# EasyEDA Pro project trumpx-ipadrescreen-ipad34-c6ab9950.epro, schematic SCH_A

## Sheets
1 main: Board Name: IPAD3_4_MB_HDMI_EDP; Create Date: 2025-06-30; Page Name: main; Project Name: IPADRESCREEN_IPAD3/4便携屏改造计划; Schematic Name: SCH_A; Update Date: 2025-07-09; Company: BSUIC; Page Size: A4; Version: V2.1
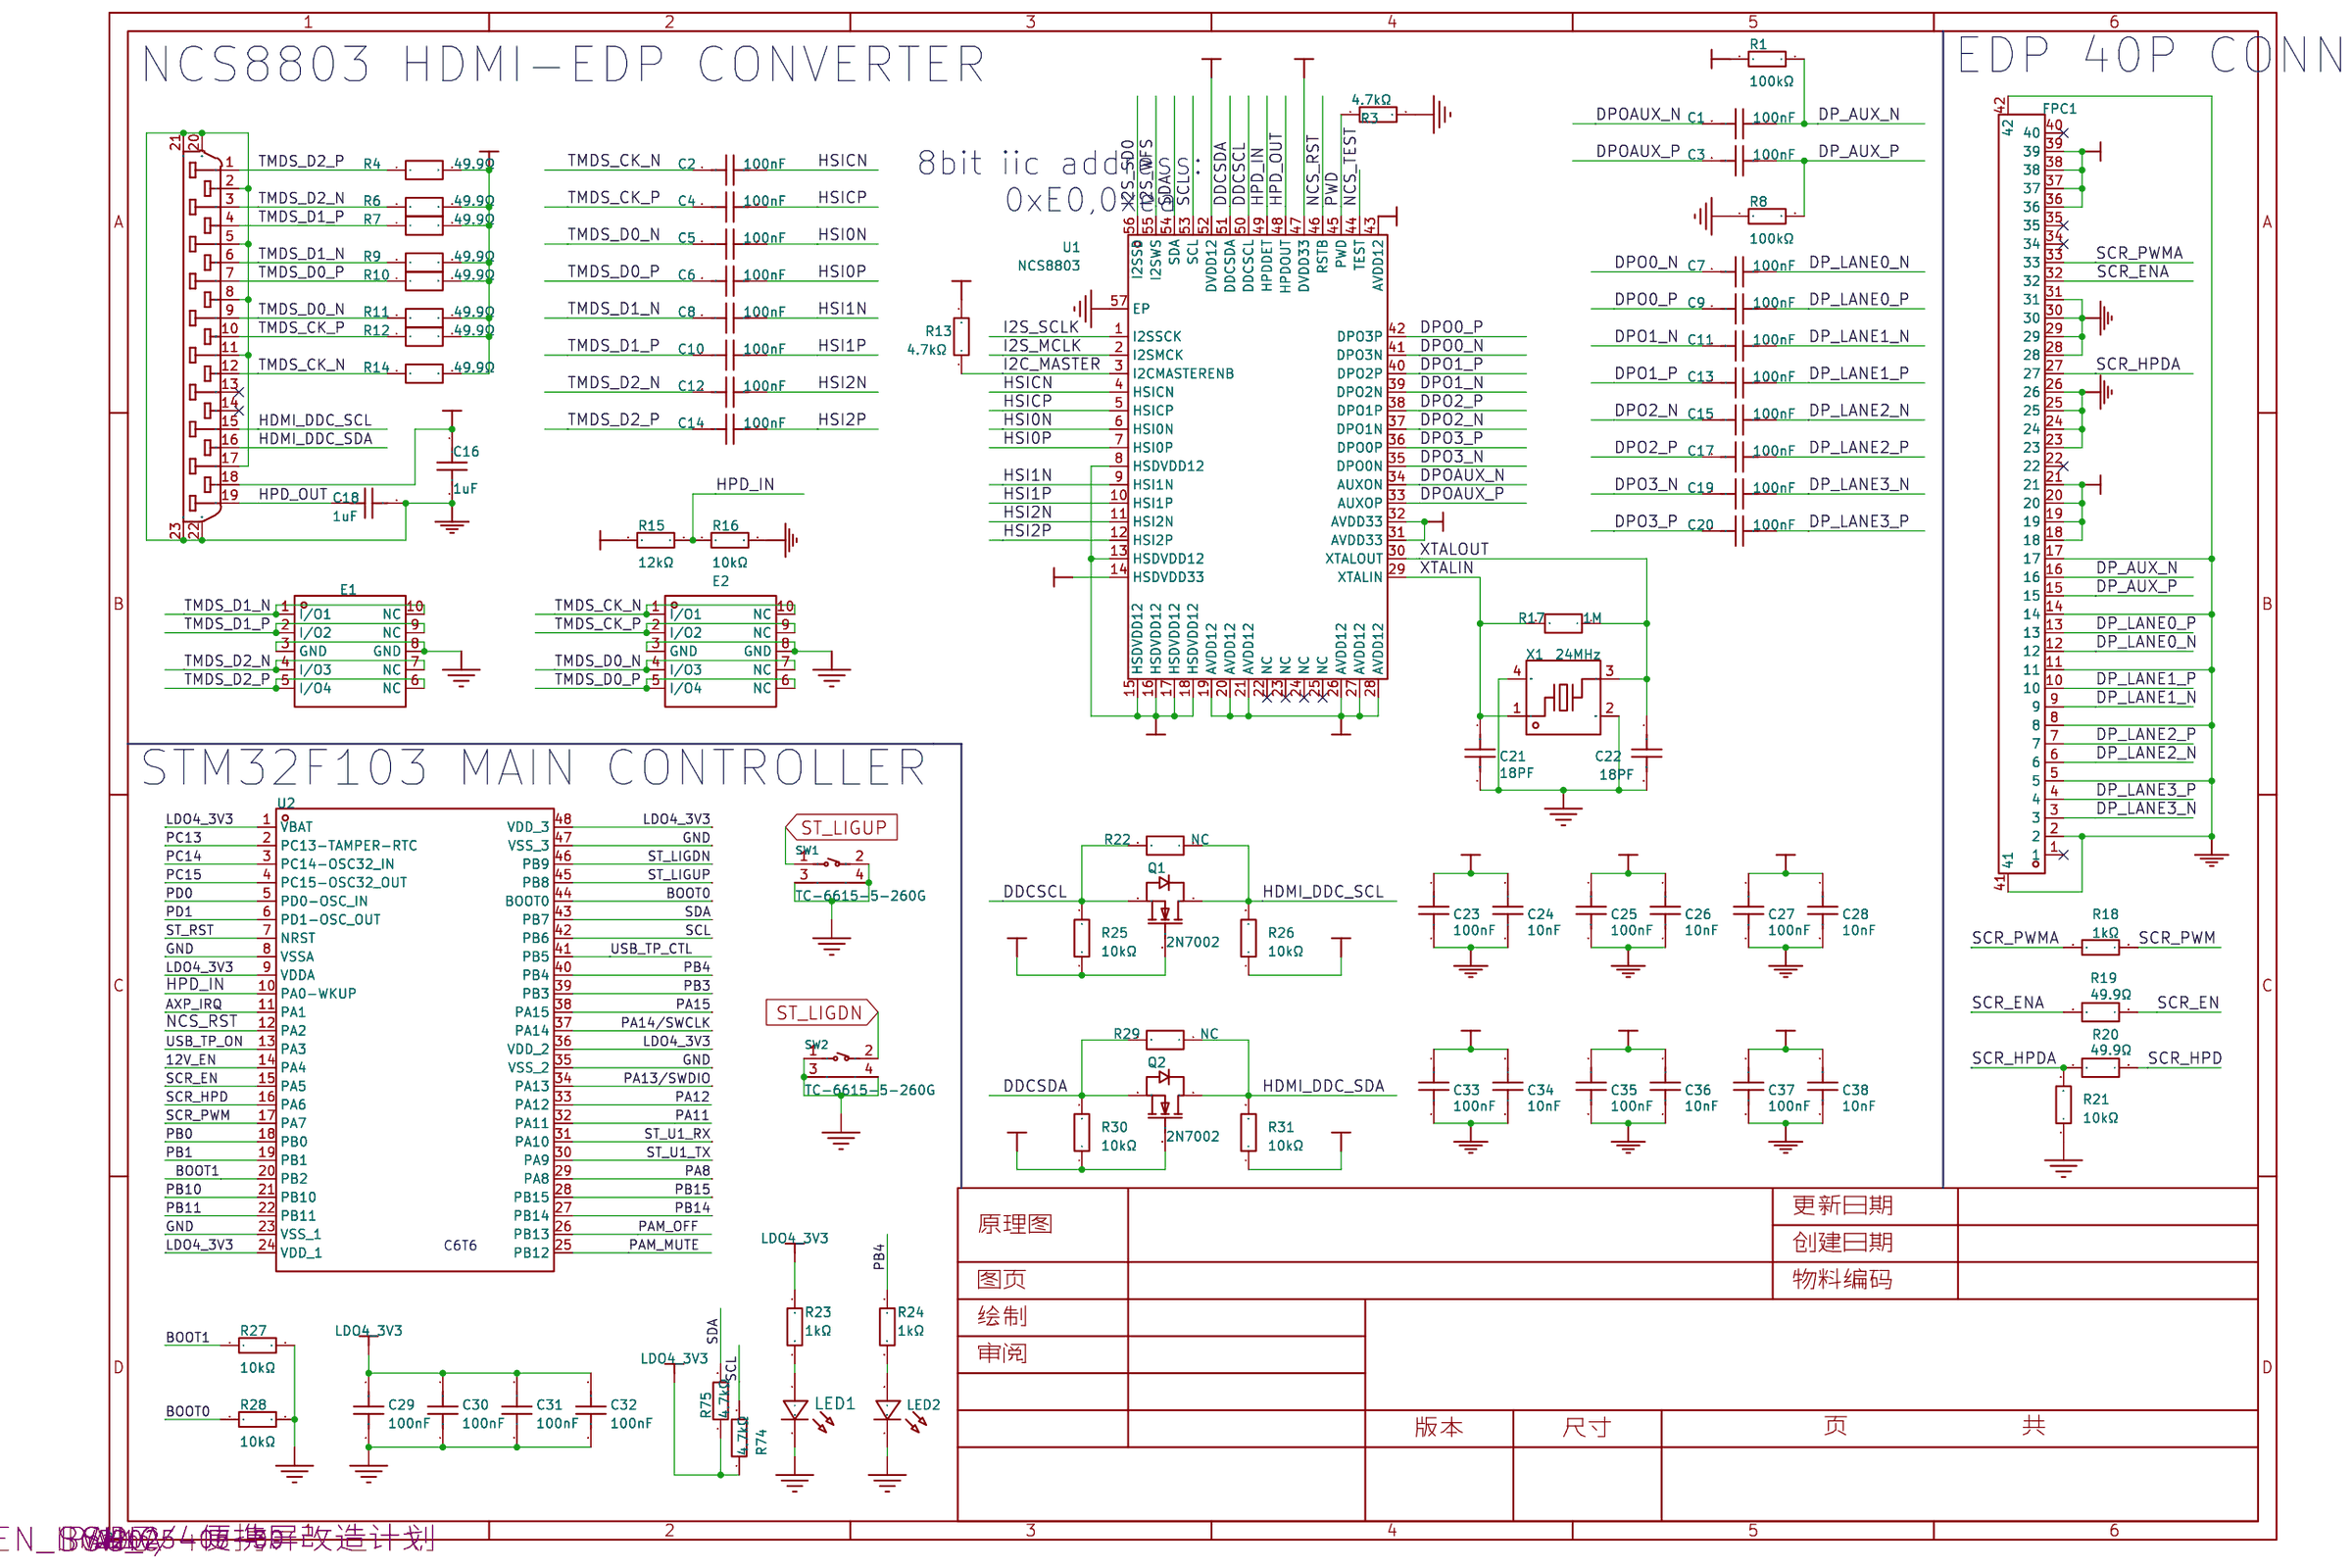
[diagram p0: main]
2 power: Page Name: power; Update Date: 2025-06-30; Company: 嘉立创EDA
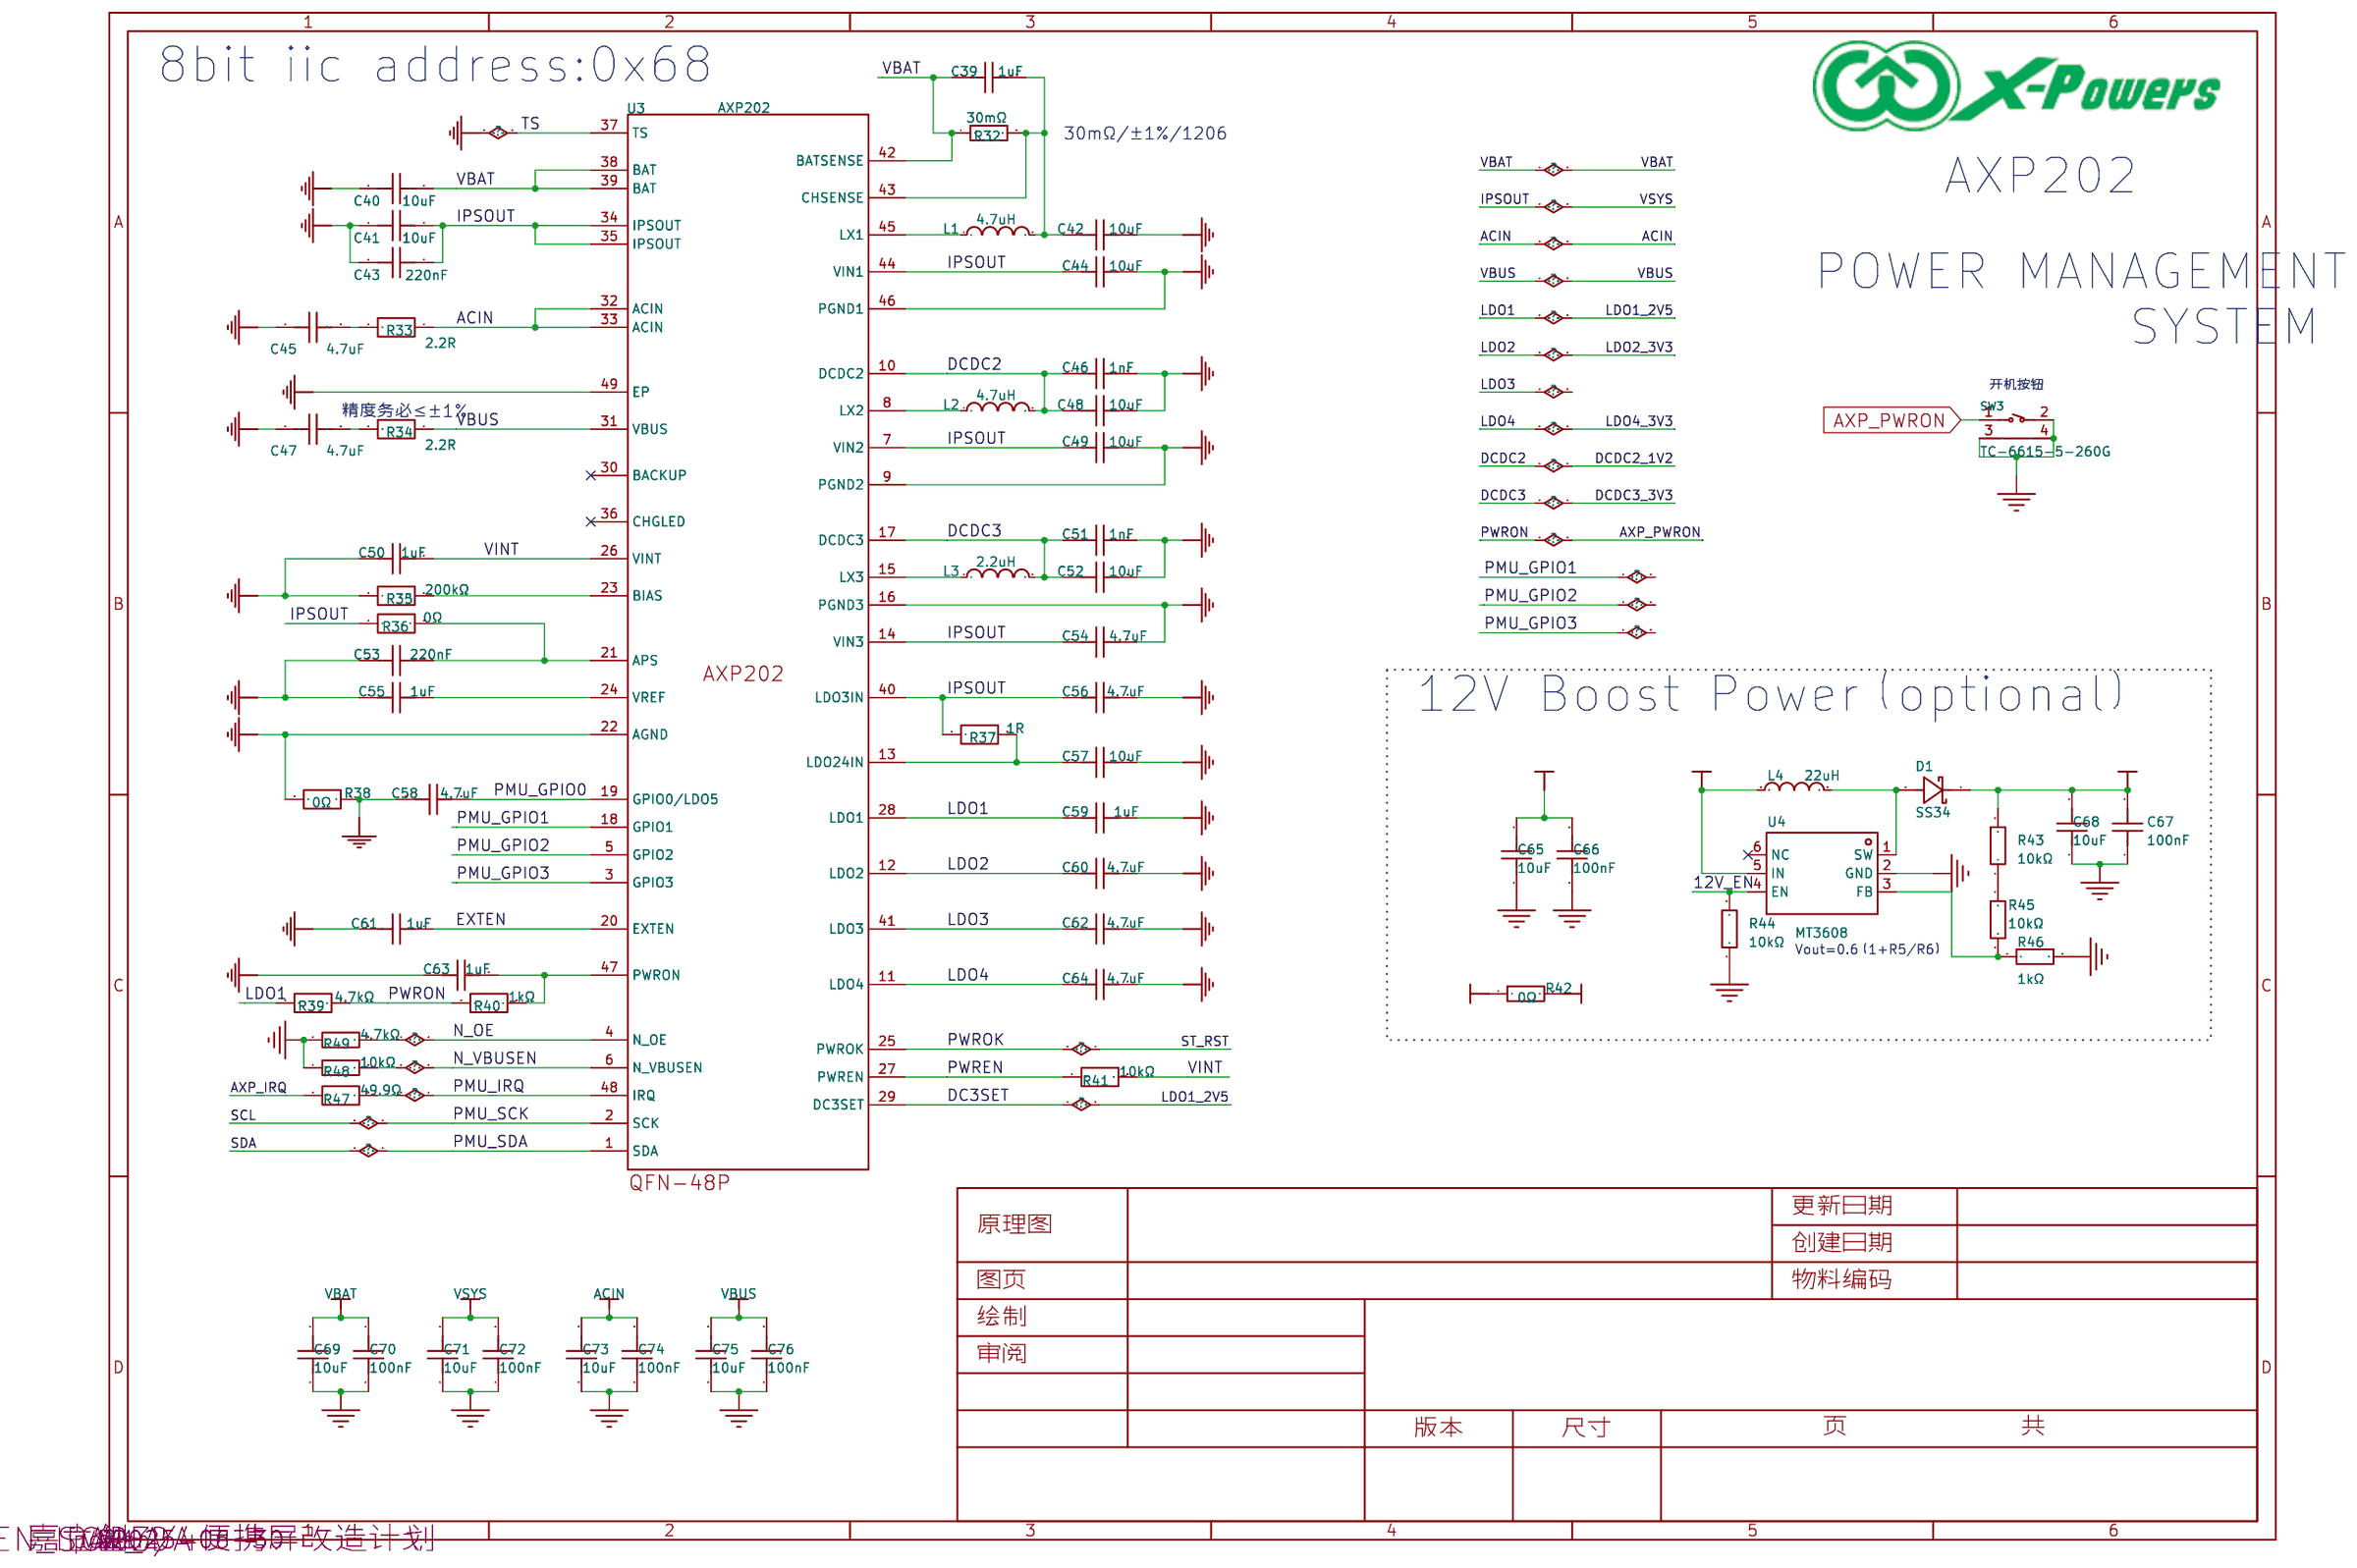
[diagram p1: power]
3 audio: Board Name: IPAD_RE_SCREEN_MB_V2.1; Page Name: audio; Project Name: IPADreSCREEN_IPAD3/4便携屏; Update Date: 2025-06-30
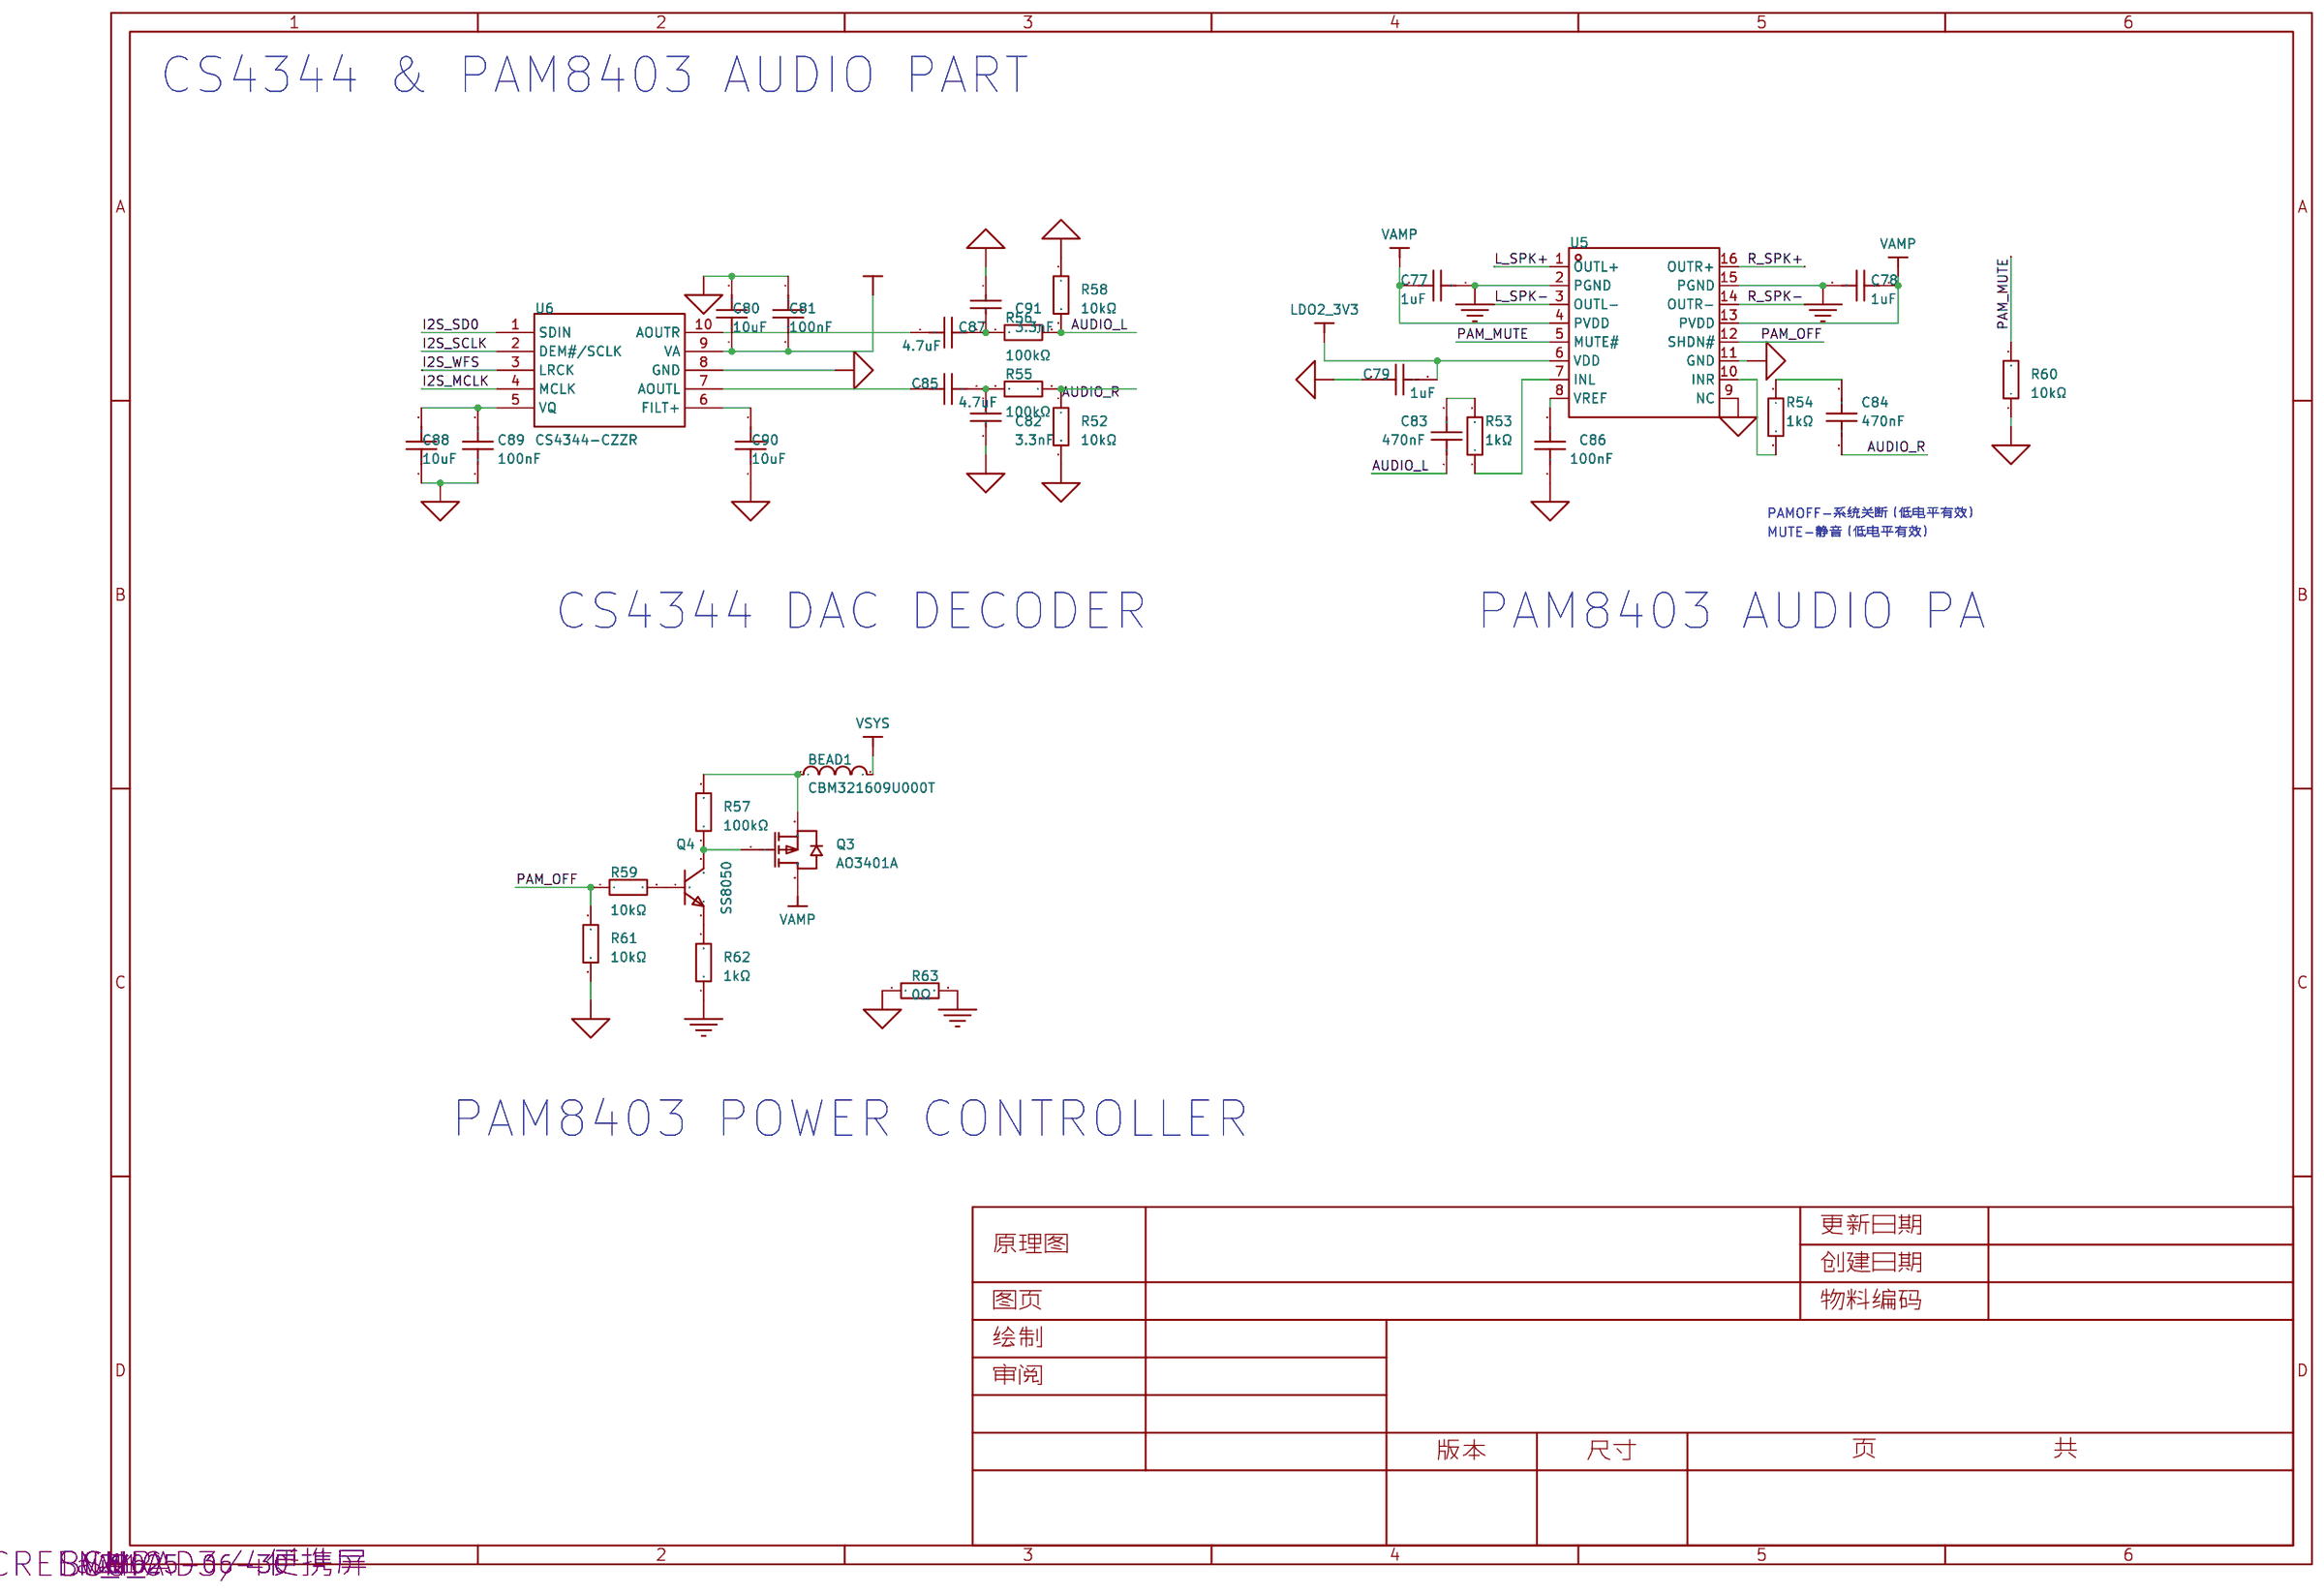
[diagram p2: audio]
4 connector: Page Name: connector; Update Date: 2025-06-30
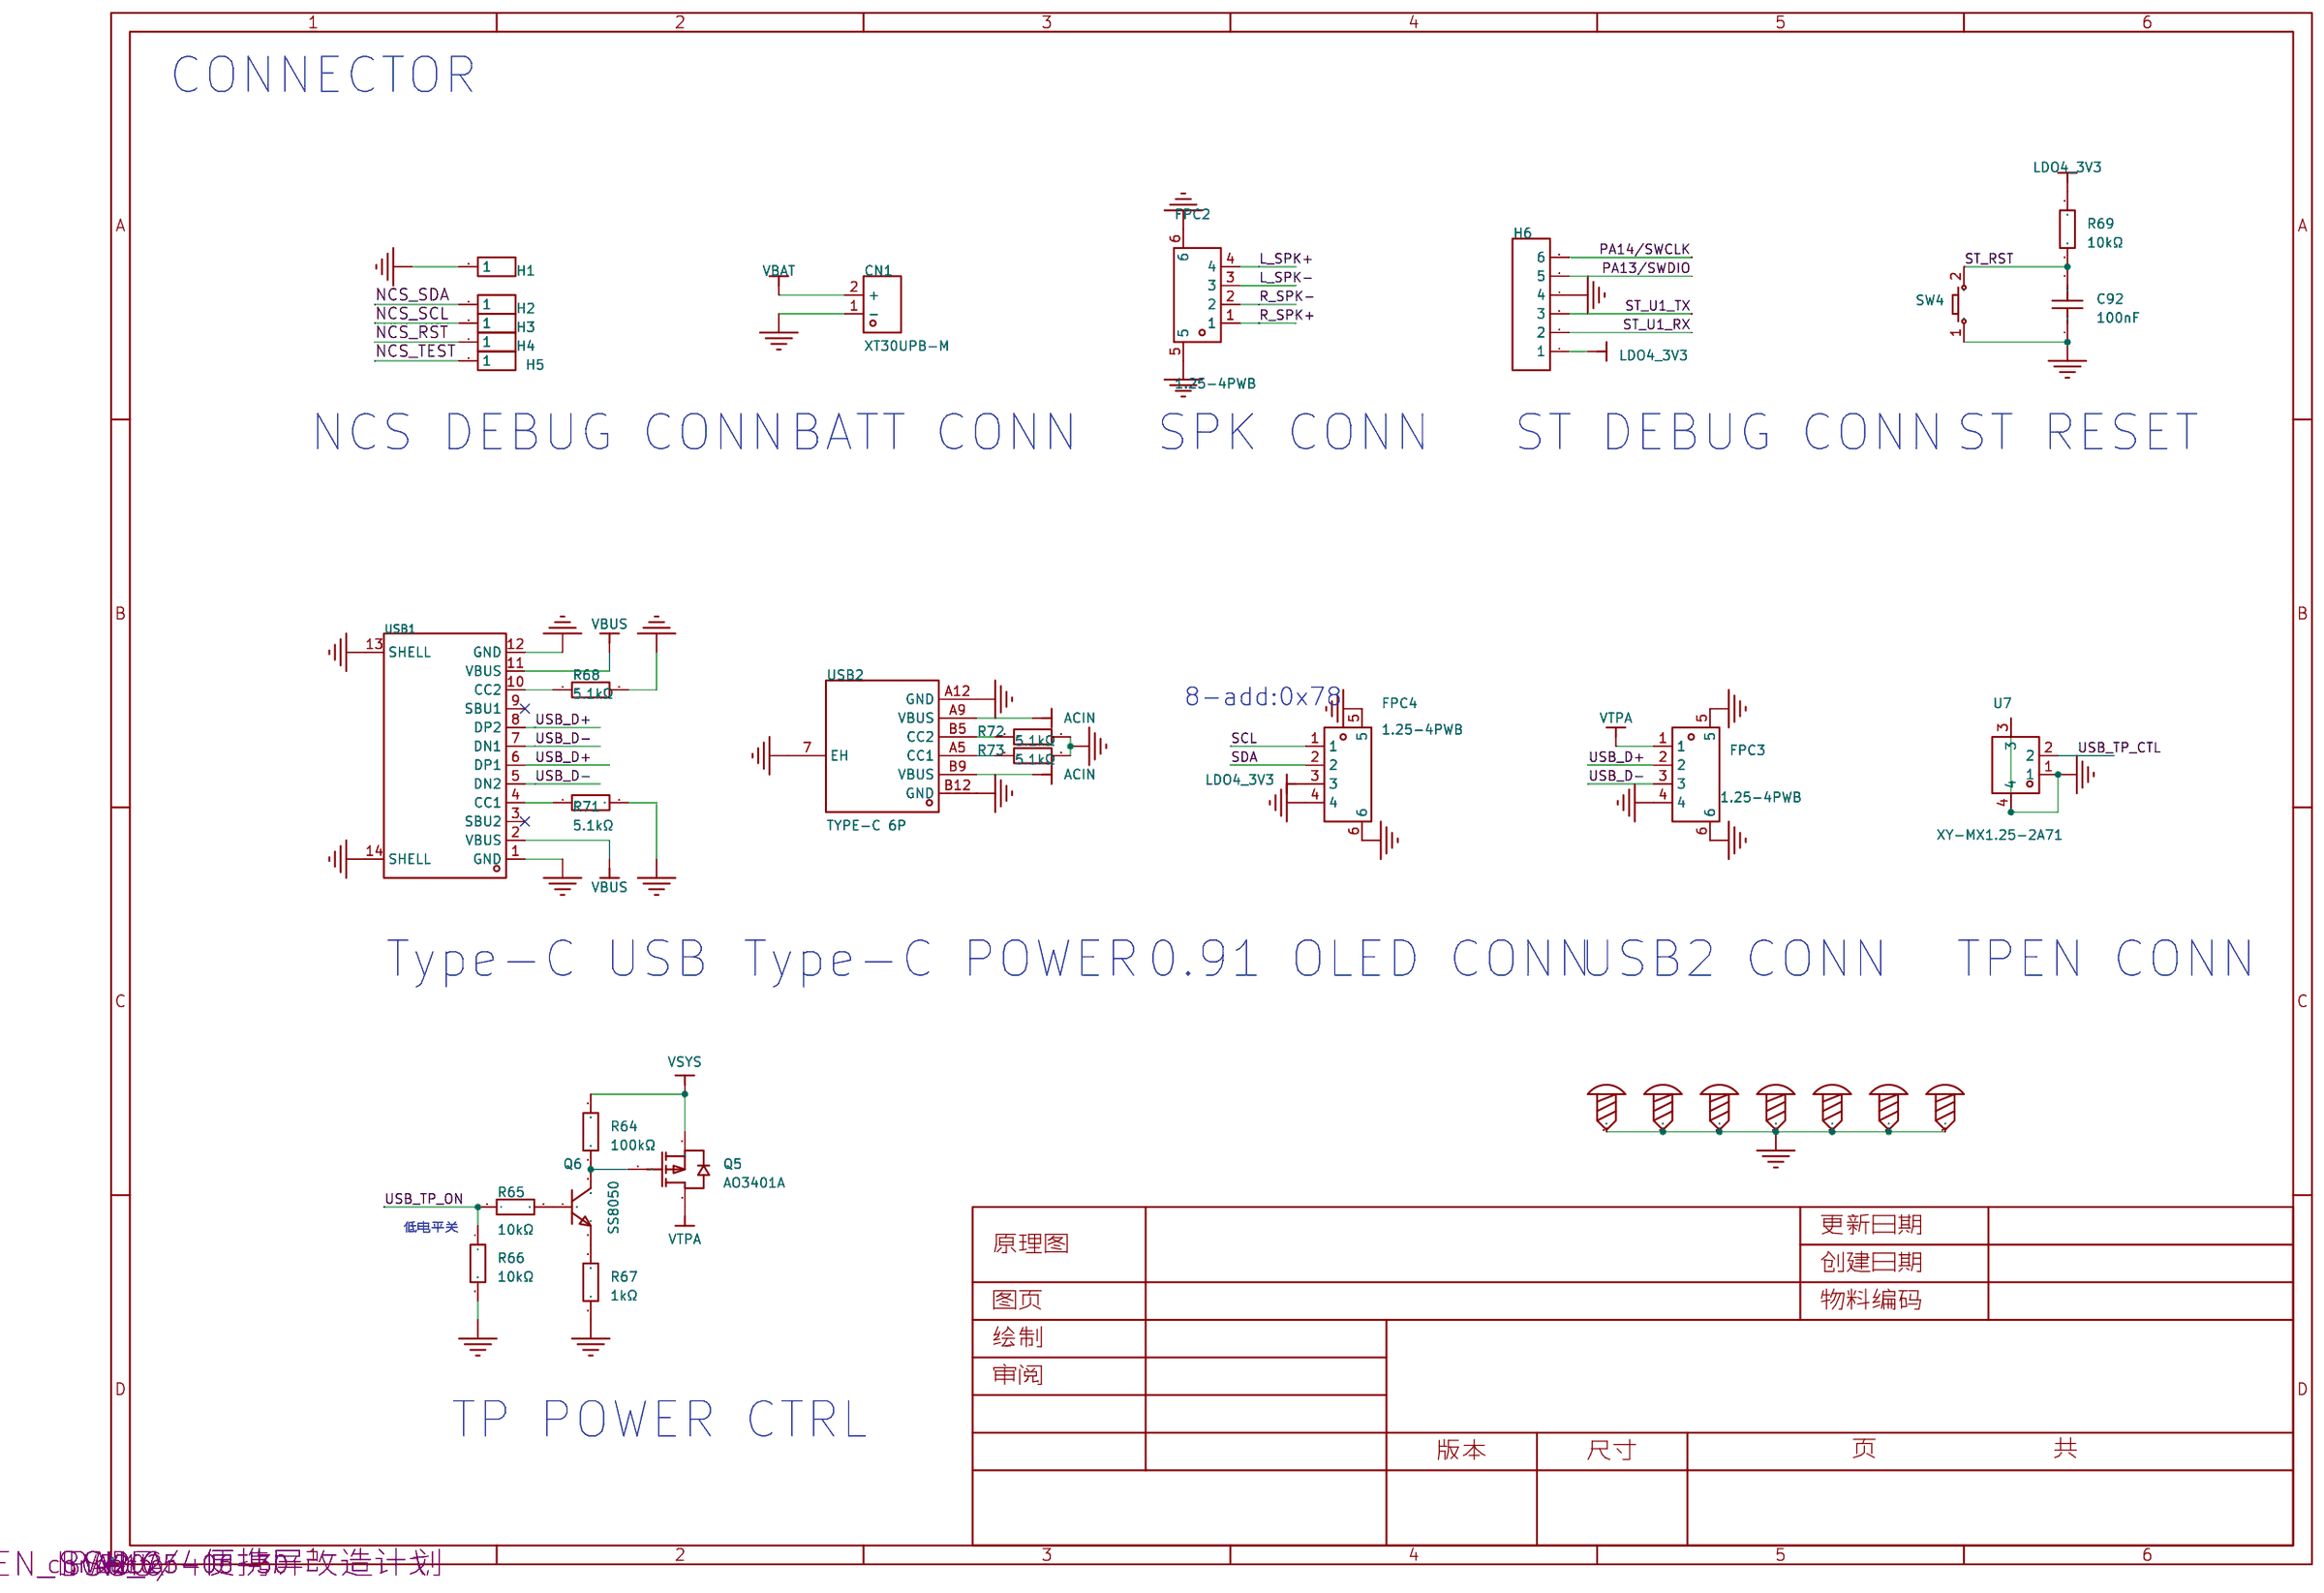
[diagram p3: connector]

## Parts
sheet audio
BEAD1  CBM321609U000T  [L1206]
C77  1uF  [C0603]
C78  1uF  [C0603]
C79  1uF  [C0603]
C80  10uF  [C0603]
C81  100nF  [C0603]
C82  3.3nF  [C0603]
C83  470nF  [c0603]
C84  470nF  [c0603]
C85  4.7uF  [C0603]
C86  100nF  [C0603]
C87  4.7uF  [C0603]
C88  10uF  [C0603]
C89  100nF  [C0603]
C90  10uF  [C0603]
C91  3.3nF  [C0603]
Q3  AO3401A  [SOT-23_L2.9-W1.3-P1.90-LS2.4-BR]
Q4  SS8050  [SOT-23-3_L2.9-W1.3-P1.90-LS2.4-BR]
R52  10kΩ  [R0603]
R53  1kΩ  [R0603]
R54  1kΩ  [R0603]
R55  100kΩ  [R0603]
R56  100kΩ  [R0603]
R57  100kΩ  [R0603]
R58  10kΩ  [R0603]
R59  10kΩ  [R0603]
R60  10kΩ  [R0603]
R61  10kΩ  [R0603]
R62  1kΩ  [R0603]
R63  0Ω  [R0603]
U5  PAM8403  [SOP-16_L10.0-W3.9-P1.27-LS6.0-BL]
U6  CS4344-CZZR  [TSSOP-10_L3.0-W3.0-P0.50-LS4.9-BL]
sheet connector
C92  100nF  [C0603]
CN1  XT30UPB-M  [CONN-TH_XT30UPB-M]
FPC2  1.25-4PWB  [CONN-SMD_1.25-4PWB]
FPC3  1.25-4PWB  [CONN-SMD_1.25-4PWB]
FPC4  1.25-4PWB  [CONN-SMD_1.25-4PWB]
H1  -  [HDR-TH_1P-V-M_XKB_X4611WV-01I-C28D40]
H2  -  [HDR-TH_1P-V-M_XKB_X4611WV-01I-C28D40]
H3  -  [HDR-TH_1P-V-M_XKB_X4611WV-01I-C28D40]
H4  -  [HDR-TH_1P-V-M_XKB_X4611WV-01I-C28D40]
H5  -  [HDR-TH_1P-V-M_XKB_X4611WV-01I-C28D40]
H6  -  [HDR-TH_6P-P2.54-V-M-1]
Q5  AO3401A  [SOT-23_L2.9-W1.3-P1.90-LS2.4-BR]
Q6  SS8050  [SOT-23-3_L2.9-W1.3-P1.90-LS2.4-BR]
R64  100kΩ  [R0603]
R65  10kΩ  [R0603]
R66  10kΩ  [R0603]
R67  1kΩ  [R0603]
R68  5.1kΩ  [R0603]
R69  10kΩ  [R0603]
R71  5.1kΩ  [R0603]
R72  5.1kΩ  [R0603]
R73  5.1kΩ  [R0603]
SCREW1  -  [M2螺丝]
SCREW2  -  [M2螺丝]
SCREW3  -  [M2螺丝]
SCREW4  -  [M2螺丝]
SCREW5  -  [M2螺丝]
SCREW6  -  [M2螺丝]
SCREW7  -  [M2螺丝]
SW4  -  [Key_SMD_3x4x2]
U7  XY-MX1.25-2A71  [CONN-SMD_2P-P1.25_XYECONN_XY-MX1.25-2A71]
USB1  TYPE-C 16PIN 2MD(073)  [USB-C-SMD_TYPE-C-6PIN-2MD-073]
USB2  TYPE-C 6P  [TYPE-C-SMD_TYPE-C-6P]
sheet main
C1  100nF  [C0402]
C2  100nF  [C0402]
C3  100nF  [C0402]
C4  100nF  [C0402]
C5  100nF  [C0402]
C6  100nF  [C0402]
C7  100nF  [C0402]
C8  100nF  [C0402]
C9  100nF  [C0402]
C10  100nF  [C0402]
C11  100nF  [C0402]
C12  100nF  [C0402]
C13  100nF  [C0402]
C14  100nF  [C0402]
C15  100nF  [C0402]
C16  1uF  [C0603]
C17  100nF  [C0402]
C18  1uF  [C0603]
C19  100nF  [C0402]
C20  100nF  [C0402]
C21  18PF  [C0402_NEW]
C22  18PF  [C0402_NEW]
C23  100nF  [C0402]
C24  10nF  [C0402]
C25  100nF  [C0402]
C26  10nF  [C0402]
C27  100nF  [C0402]
C28  10nF  [C0402]
C29  100nF  [C0603]
C30  100nF  [C0603]
C31  100nF  [C0603]
C32  100nF  [C0603]
C33  100nF  [C0402]
C34  10nF  [C0402]
C35  100nF  [C0402]
C36  10nF  [C0402]
C37  100nF  [C0402]
C38  10nF  [C0402]
E1  RCLAMP0524P_C907837  [DFN2510-10_L2.5-W1.0-P0.50-BL]
E2  RCLAMP0524P_C907837  [DFN2510-10_L2.5-W1.0-P0.50-BL]
FPC1  X05A15L40T  [FFC-SMD_40P-P0.50_XKB_X05A15L40T]
HDMI1  HDMI-SWM-19  [HDMI-SMD_19P-P0.50-H-F]
LED1  -  [LED_0603]
LED2  -  [LED_0603]
Q1  2N7002  [SOT-23-3_L2.9-W1.3-P1.90-LS2.4-BR]
Q2  2N7002  [SOT-23-3_L2.9-W1.3-P1.90-LS2.4-BR]
R1  100kΩ  [R0603]
R3  4.7kΩ  [R0603]
R4  49.9Ω  [R0402]
R6  49.9Ω  [R0402]
R7  49.9Ω  [R0402]
R8  100kΩ  [R0603]
R9  49.9Ω  [R0402]
R10  49.9Ω  [R0402]
R11  49.9Ω  [R0402]
R12  49.9Ω  [R0402]
R13  4.7kΩ  [R0603]
R14  49.9Ω  [R0402]
R15  12kΩ  [R0603]
R16  10kΩ  [R0603]
R17  1M  [R0402]
R18  1kΩ  [R0603]
R19  49.9Ω  [R0402]
R20  49.9Ω  [R0402]
R21  10kΩ  [R0603]
R22  NC  [R0402]
R23  1kΩ  [R0603]
R24  1kΩ  [R0603]
R25  10kΩ  [R0603]
R26  10kΩ  [R0603]
R27  10kΩ  [R0603]
R28  10kΩ  [R0603]
R29  NC  [R0402]
R30  10kΩ  [R0603]
R31  10kΩ  [R0603]
R74  4.7kΩ  [R0603]
R75  4.7kΩ  [R0603]
SW1  TC-6615-5-260G  [SW-TH_4P-L7.5-W5.0-P4.50]
SW2  TC-6615-5-260G  [SW-TH_4P-L7.5-W5.0-P4.50]
U1  NCS8803  [QFN-56_L7.0-W7.0-P0.40-TL-EP5.2]
U2  STM32F103C8T6  [LQFP-48_L7.0-W7.0-P0.50-LS9.0-BL]
X1  24MHz  [CRYSTAL-SMD_4P-L2.5-W2.0-BL-A]
sheet power
C39  1uF  [C0603]
C40  10uF  [C0603]
C41  10uF  [C0603]
C42  10uF  [C0603]
C43  220nF  [C0603]
C44  10uF  [C0603]
C45  4.7uF  [C0603]
C46  1nF  [C0603]
C47  4.7uF  [C0603]
C48  10uF  [C0603]
C49  10uF  [C0603]
C50  1uF  [C0603]
C51  1nF  [C0603]
C52  10uF  [C0603]
C53  220nF  [C0603]
C54  4.7uF  [C0603]
C55  1uF  [C0603]
C56  4.7uF  [C0603]
C57  10uF  [C0603]
C58  4.7uF  [C0603]
C59  1uF  [C0603]
C60  4.7uF  [C0603]
C61  1uF  [C0603]
C62  4.7uF  [C0603]
C63  1uF  [C0603]
C64  4.7uF  [C0603]
C65  10uF  [C0603]
C66  100nF  [C0603]
C67  100nF  [C0603]
C68  10uF  [C0603]
C69  10uF  [C0603]
C70  100nF  [C0603]
C71  10uF  [C0603]
C72  100nF  [C0603]
C73  10uF  [C0603]
C74  100nF  [C0603]
C75  10uF  [C0603]
C76  100nF  [C0603]
D1  SS34  [SMA_L4.3-W2.5-LS5.0-RD]
L1  4.7uH  [IND-SMD_L3.5-W3.0]
L2  4.7uH  [IND-SMD_L3.5-W3.0]
L3  2.2uH  [IND-SMD_L3.5-W3.0]
L4  22uH  [IND-SMD_L4.6-W4.2_SMMS0420]
R32  30mΩ  [R1206]
R33  2.2R  [R0402]
R34  2.2R  [R0402]
R35  200kΩ  [R0402]
R36  0Ω  [R0603]
R37  1R  [R0402]
R38  0Ω  [R0603]
R39  4.7kΩ  [R0603]
R40  1kΩ  [R0603]
R41  10kΩ  [R0603]
R42  0Ω  [R1206]
R43  10kΩ  [R0603]
R44  10kΩ  [R0603]
R45  10kΩ  [R0603]
R46  1kΩ  [R0603]
R47  49.9Ω  [R0402]
R48  10kΩ  [R0603]
R49  4.7kΩ  [R0603]
SW3  TC-6615-5-260G  [SW-TH_4P-L7.5-W5.0-P4.50]
U3  AXP202  [AXP202]
U4  MT3608  [SOT-23-6_L2.9-W1.6-P0.95-LS2.8-BL]

## Library data of the parts
BEAD1 = CBM321609U000T: 阻抗@频率:0Ω@100MHz;直流电阻(DCR):-;; LCSC Part Name: 单路 1206磁珠 阻抗0Ω@100MHz; Supplier Part: C391206; Manufacturer: FH(风华); Supplier Footprint: 1206; JLCPCB Part Class: 扩展库; Datasheet: https://atta.szlcsc.com/upload/public/pdf/source/20240820/4C67C1C766AC972D1D71521C78B340C6.pdf; Supplier: LCSC; Impedance @ Frequency: 0Ω@100MHz; Number of Circuits: 1
C16 C18 C39 C50 C55 C59 C61 C63 C77-C79 = CL10A105KB8NNNC: 容值:1uF;精度:±10%;额定电压:50V;材质(温度系数):X5R;; LCSC Part Name: 1uF ±10% 50V; Supplier Part: C15849; Manufacturer: SAMSUNG(三星); Supplier Footprint: 0603; JLCPCB Part Class: Basic Part; Datasheet: https://atta.szlcsc.com/upload/public/pdf/source/20160218/1457707763339.pdf; Supplier: LCSC; Tolerance: ±10%; Voltage Rated: 50V; Temperature Coefficient: X5R
C40-C42 C44 C48 C49 C52 C57 C65 C68 C69 C71 C73 C75 C80 C88 C90 = CL10A106KP8NNNC: 容值:10uF;精度:±10%;额定电压:10V;材质(温度系数):X5R;; LCSC Part Name: 10uF ±10% 10V; Supplier Part: C19702; Manufacturer: SAMSUNG(三星); Supplier Footprint: 0603; JLCPCB Part Class: Basic Part; Datasheet: https://atta.szlcsc.com/upload/public/pdf/source/20160218/1457707763339.pdf; Supplier: LCSC; Tolerance: ±10%; Voltage Rated: 10V; Temperature Coefficient: X5R
C29-C32 C66 C67 C70 C72 C74 C76 C81 C86 C89 C92 = CC0603KRX7R9BB104: 容值:100nF;精度:±10%;额定电压:50V;材质(温度系数):X7R;; LCSC Part Name: 100nF ±10% 50V; Supplier Part: C14663; Manufacturer: YAGEO(国巨); Supplier Footprint: 0603; JLCPCB Part Class: 基础库; Datasheet: https://atta.szlcsc.com/upload/public/pdf/source/20180910/C282072_33301C7F631E79921B82A8DAC6BCC5B3.pdf; Supplier: LCSC; Tolerance: ±10%; Voltage Rated: 50V; Temperature Coefficient: X7R
C82 C91 = CL10B332KB8NNNC: 容值:3.3nF;精度:±10%;额定电压:50V;材质(温度系数):X7R;; LCSC Part Name: 3.3nF ±10% 50V; Supplier Part: C1613; Manufacturer: SAMSUNG(三星); Supplier Footprint: 0603; JLCPCB Part Class: Basic Part; Datasheet: https://atta.szlcsc.com/upload/public/pdf/source/20160218/1457707763339.pdf; Supplier: LCSC; Tolerance: ±10%; Voltage Rated: 50V; Temperature Coefficient: X7R
C83 C84 = CL10B474KA8NNNC: 容值:470nF;精度:±10%;额定电压:25V;材质(温度系数):X7R;; LCSC Part Name: 470nF ±10% 25V; Supplier Part: C1623; Manufacturer: SAMSUNG(三星); Supplier Footprint: 0603; JLCPCB Part Class: Basic Part; Datasheet: https://atta.szlcsc.com/upload/public/pdf/source/20160218/1457707763339.pdf; Supplier: LCSC; Tolerance: ±10%; Voltage Rated: 25V; Temperature Coefficient: X7R
C45 C47 C54 C56 C58 C60 C62 C64 C85 C87 = CL10A475KO8NNNC: 容值:4.7uF;精度:±10%;额定电压:16V;材质(温度系数):X5R;; LCSC Part Name: 4.7uF ±10% 16V; Supplier Part: C19666; Manufacturer: SAMSUNG(三星); Supplier Footprint: 0603; JLCPCB Part Class: Basic Part; Datasheet: https://atta.szlcsc.com/upload/public/pdf/source/20160218/1457707763339.pdf; Supplier: LCSC; Tolerance: ±10%; Voltage Rated: 16V; Temperature Coefficient: X5R
Q3 Q5 = AO3401A_C15127: 类型:1个P沟道;漏源电压(Vdss):30V;连续漏极电流(Id):4A;导通电阻(RDS(on)@Vgs,Id):44mΩ@10V,4.3A;功率(Pd):1.4W;阈值电压(Vgs(th)@Id):1.3V@250uA;; LCSC Part Name: 1个P沟道 耐压:30V 电流:4A; Supplier Part: C15127; Manufacturer: AOS; Supplier Footprint: SOT-23; JLCPCB Part Class: 基础库; Datasheet: https://atta.szlcsc.com/upload/public/pdf/source/20160507/1462613609053.pdf; Supplier: LCSC; Type: 1个P沟道; Drain Source Voltage (Vdss): 30V; Continuous Drain Current (Id): 4A; Drain Source On Resistance (RDS(on)@Vgs,Id): 44mΩ@10V,4.3A; Power Dissipation (Pd): 1.4W; Gate Threshold Voltage (Vgs(th)@Id): 1.3V@250uA; Total Gate Charge (Qg@Vgs): 12.2nC@4.5V; Input Capacitance (Ciss@Vds): 1.2nF@15V; Operating Temperature: -55℃~+150℃@(Tj)
Q4 Q6 = SS8050(RANGE:200-350)_C2150: 晶体管类型:NPN;集电极电流(Ic):1.5A;集射极击穿电压(Vceo):25V;功率(Pd):300mW;直流电流增益(hFE@Ic,Vce):200@800mA,1V;; LCSC Part Name: NPN 电流:1.5A 耐压:25V hfe=200~350; Supplier Part: C2150; Manufacturer: CJ(江苏长电/长晶); Supplier Footprint: SOT-23; JLCPCB Part Class: 基础库; Datasheet: https://atta.szlcsc.com/upload/public/pdf/source/20230322/AEE86F4B043774EFF80CAEA14A37D9E9.pdf; Supplier: LCSC; Transistor Type: NPN; Collector Current (Ic): 1.5A; Collector-Emitter Breakdown Voltage (Vceo): 25V; Power Dissipation (Pd): 300mW; DC Current Gain (hFE@Ic,Vce): 200@800mA,1V; Transition Frequency (fT): 100MHz; Collector Cut-Off Current (Icbo): 100nA; Collector-Emitter Saturation Voltage (VCE(sat)@Ic,Ib): 500mV@800mA,80mA; Operating Temperature: -55℃~+150℃
R16 R21 R25-R28 R30 R31 R41 R43-R45 R48 R52 R58-R61 R65 R66 R69 = 0603WAF1002T5E: 电阻类型:厚膜电阻;阻值:10kΩ;精度:±1%;功率:100mW;最大工作电压:75V;温度系数:±100ppm/℃;; LCSC Part Name: 厚膜电阻 10kΩ ±1% 100mW; Supplier Part: C25804; Manufacturer: UNI-ROYAL(厚声); Supplier Footprint: 0603; JLCPCB Part Class: 基础库; Datasheet: https://atta.szlcsc.com/upload/public/pdf/source/20200306/C422600_1E6D84923E4A46A82E41ADD87F860B5C.pdf; Supplier: LCSC; Type: 厚膜电阻; Tolerance: ±1%; Power(Watts): 100mW; Overload Voltage (Max): 75V; Temperature Coefficient: ±100ppm/℃; Operating Temperature Range: -55℃~+155℃
R18 R23 R24 R46 R53 R54 R62 R67 = 0603WAF1001T5E: 电阻类型:厚膜电阻;阻值:1kΩ;精度:±1%;功率:100mW;最大工作电压:75V;温度系数:±100ppm/℃;; LCSC Part Name: 1kΩ ±1% 100mW 厚膜电阻; Supplier Part: C21190; Manufacturer: UNI-ROYAL(厚声); Supplier Footprint: 0603; JLCPCB Part Class: Basic Part; Datasheet: https://atta.szlcsc.com/upload/public/pdf/source/20200306/C422600_1E6D84923E4A46A82E41ADD87F860B5C.pdf; Supplier: LCSC; Type: 厚膜电阻; Tolerance: ±1%; Power(Watts): 100mW; Overload Voltage (Max): 75V; Temperature Coefficient: ±100ppm/℃; Operating Temperature Range: -55℃~+155℃
R1 R8 R55-R57 R64 = 0603WAF1003T5E: 电阻类型:厚膜电阻;阻值:100kΩ;精度:±1%;功率:100mW;最大工作电压:75V;温度系数:±100ppm/℃;; LCSC Part Name: 100kΩ ±1% 100mW 厚膜电阻; Supplier Part: C25803; Manufacturer: UNI-ROYAL(厚声); Supplier Footprint: 0603; JLCPCB Part Class: 基础库; Datasheet: https://atta.szlcsc.com/upload/public/pdf/source/20200306/C422600_1E6D84923E4A46A82E41ADD87F860B5C.pdf; Supplier: LCSC; Type: 厚膜电阻; Tolerance: ±1%; Power(Watts): 100mW; Overload Voltage (Max): 75V; Temperature Coefficient: ±100ppm/℃; Operating Temperature Range: -55℃~+155℃
R36 R38 R63 = 0603WAF0000T5E: 电阻类型:厚膜电阻;阻值:0Ω;精度:±1%;功率:100mW;最大工作电压:75V;; LCSC Part Name: 0Ω ±1% 100mW 厚膜电阻; Supplier Part: C21189; Manufacturer: UNI-ROYAL(厚声); Supplier Footprint: 0603; JLCPCB Part Class: Basic Part; Datasheet: https://atta.szlcsc.com/upload/public/pdf/source/20200306/C422600_1E6D84923E4A46A82E41ADD87F860B5C.pdf; Supplier: LCSC; Type: 厚膜电阻; Tolerance: ±1%; Power(Watts): 100mW; Overload Voltage (Max): 75V; Operating Temperature Range: -55℃~+155℃
U5 = PAM8403: Supplier Part: C5122557; Manufacturer: Slkor(萨科微); Supplier Footprint: SOP-16; JLCPCB Part Class: Extended Part; Datasheet: https://atta.szlcsc.com/upload/public/pdf/source/20220804/9492825CE73F800847FAA8BB0D21CD85.pdf; Supplier: LCSC
U6 = CS4344-CZZR: 分辨率:24位;接口:I2S;电源电压:3V~3.47V;稳定时间:-;INL/DNL:-;; LCSC Part Name: 停产; Supplier Part: C8952; Manufacturer: Cirrus Logic(凌云); Supplier Footprint: TSSOP-10-3mm; JLCPCB Part Class: Extended Part; Datasheet: https://atta.szlcsc.com/upload/public/pdf/source/20120829/1457706532988.pdf; Supplier: LCSC; Resolution: 24位; Number of Channels: 2; Interface: I2S; Supply Voltage: 3V~3.47V; Operating Temperature: -10℃~+70℃
CN1 = XT30UPB-M: 类别:-;类型1:-;; LCSC Part Name: AMASS(艾迈斯)板载立式 航模锂电池控制器连接器插头 公头XT30UPB-M; Supplier Part: C428721; Manufacturer: AMASS(艾迈斯); JLCPCB Part Class: 扩展库; Datasheet: https://atta.szlcsc.com/upload/public/pdf/source/20230412/7B5DFEF57C9EA5273853390C734B3AC5.pdf; Supplier: LCSC; Brand: 艾迈斯; Type: 航模插头; Colour: 黄色; RatedVoltage: DC 500V; InterfaceType: 公头; MetalMaterial: 镀金; InsulationMaterial: PA; RatedCurrent: 15A; contact resistance: 0.65mΩ
FPC2-FPC4 = 1.25-4PWB: 插针结构:1x4P;间距:1.25mm;安装方式:卧贴;参考系列:-;总PIN数:4P;排数:1;每排PIN数:4;行距:-;额定电流:-;工作温度范围:-40℃~+85℃;; LCSC Part Name: 1x4P 间距:1.25mm 卧贴; Supplier Part: C2905011; Manufacturer: DEALON(德艺隆); Supplier Footprint: SMD,P=1.25mm,卧贴; JLCPCB Part Class: Extended Part; Datasheet: https://atta.szlcsc.com/upload/public/pdf/source/20231123/1AE0876AE9C7DCFC0D68EAC4CBA881B0.pdf; Supplier: LCSC; Pins Structure: 1x4P; Pitch: 1.25mm; Mounting Style: 卧贴; Number of Pins: 4P; Number of Rows: 1; Number of PINs Per Row: 4; Operating Temperature Range: -40℃~+85℃
H1-H5 = HDR-M_2.54_1x1P: Supplier Part: C81276; Supplier Footprint: 插件; JLCPCB Part Class: Extended Part
H6 = HDR-M_2.54_1x6P: Supplier Part: C37208; Supplier Footprint: 插件
R68 R71-R73 = 0603WAF5101T5E: 电阻类型:厚膜电阻;阻值:5.1kΩ;精度:±1%;功率:100mW;最大工作电压:75V;温度系数:±100ppm/℃;; LCSC Part Name: 5.1kΩ ±1% 100mW 厚膜电阻; Supplier Part: C23186; Manufacturer: UNI-ROYAL(厚声); Supplier Footprint: 0603; JLCPCB Part Class: 基础库; Datasheet: https://atta.szlcsc.com/upload/public/pdf/source/20200306/C422600_1E6D84923E4A46A82E41ADD87F860B5C.pdf; Supplier: LCSC; Type: 厚膜电阻; Tolerance: ±1%; Power(Watts): 100mW; Overload Voltage (Max): 75V; Temperature Coefficient: ±100ppm/℃; Operating Temperature Range: -55℃~+155℃
SCREW1-SCREW7 = M2螺丝: Supplier Footprint: 插件
SW4 = Key_SMD_3x4x2: Supplier Footprint: SMD
U7 = XY-MX1.25-2A71: 插针结构:1x2P;间距:1.25mm;安装方式:卧贴;总PIN数:2P;排数:1;每排PIN数:2;行距:2mm;; LCSC Part Name: 间距:1.25 1x2P 超薄; Supplier Part: C19272032; Manufacturer: XYECONN(辛译); Supplier Footprint: SMD,P=1.25mm,卧贴; JLCPCB Part Class: 扩展库; Datasheet: https://atta.szlcsc.com/upload/public/pdf/source/20231128/F569DA3B5EE643A17439E52EEA475E0C.pdf; Supplier: LCSC; Pins Structure: 1x2P; Pitch: 1.25mm; Mounting Style: 卧贴; Number of Pins: 2P; Number of Rows: 1; Number of PINs Per Row: 2; Row Spacing: 2mm
USB1 = TYPE-C 16PIN 2MD(073): 连接器类型:Type-C;标准:-;公母:母座;触点数量:16;端口数量:1;安装方式:卧贴;额定电流 - 电源:5A;工作温度范围:-25℃~+85℃;; LCSC Part Name: TYPE-C母座 16P 4脚插件带定位柱 不锈钢外壳 2次模顶; Supplier Part: C2765186; Manufacturer: SHOU HAN(首韩); Supplier Footprint: SMD; JLCPCB Part Class: 扩展库; Supplier: LCSC; Connector Type: Type-C; Gender: 母座; Number of Contacts: 16; Number of Ports: 1; Mounting Style: 卧贴; Current Rating - Power (Max): 5A; Operating Temperature Range: -25℃~+85℃
USB2 = TYPE-C 6P: 连接器类型:Type-C;标准:USB 3.1;公母:母;安装方式:卧贴;触点数量:6P;端口数量:1;额定电流 - 电源:5A;工作温度范围:-40℃~+85℃;; LCSC Part Name: Type-C 母 卧贴; Supplier Part: C456012; Manufacturer: SHOU HAN(首韩); Supplier Footprint: SMD; JLCPCB Part Class: Extended Part; Datasheet: https://atta.szlcsc.com/upload/public/pdf/source/20201203/C456012_B13F72044DF846EDBE9BDD0D1D3CD166.pdf; Supplier: LCSC; Connector Type: Type-C; Standard: USB 3.1; Gender: 母; Mounting Style: 卧贴; Number of Contacts: 6P; Number of Ports: 1; Current Rating - Power (Max): 5A; Operating Temperature Range: -40℃~+85℃; Rated Voltage (Max): 20V; Connect-Disconnect Life: 3千次; Core Colour: 黑色
C1-C15 C17 C19 C20 C23 C25 C27 C33 C35 C37 = CC0402KRX7R7BB104: 容值:100nF;精度:±10%;额定电压:16V;材质(温度系数):X7R;; LCSC Part Name: 100nF ±10% 16V; Supplier Part: C60474; Manufacturer: YAGEO(国巨); Supplier Footprint: 0402; JLCPCB Part Class: Extended Part; Datasheet: https://atta.szlcsc.com/upload/public/pdf/source/20211223/9278FD768280B81DDBEF48FA36411A03.pdf; Supplier: LCSC; Tolerance: ±10%; Voltage Rated: 16V; Temperature Coefficient: X7R
C21 C22 = 18PF: Supplier Part: C1525
C24 C26 C28 C34 C36 C38 = CL05B103KB5NNNC: 容值:10nF;精度:±10%;额定电压:50V;材质(温度系数):X7R;; LCSC Part Name: 10nF ±10% 50V; Supplier Part: C15195; Manufacturer: SAMSUNG(三星); Supplier Footprint: 0402; JLCPCB Part Class: Basic Part; Datasheet: https://atta.szlcsc.com/upload/public/pdf/source/20160218/1457707763339.pdf; Supplier: LCSC; Tolerance: ±10%; Voltage Rated: 50V; Temperature Coefficient: X7R
E1 E2 = RCLAMP0524P: Supplier: LCSC; Supplier Part: C907837; Manufacturer: TECH PUBLIC; JLCPCB Part Class: Extended Part
FPC1 = X05A15L40T: Supplier: LCSC; Supplier Part: C2879928; Manufacturer: XKB Connectivity(中国星坤); JLCPCB Part Class: Extended Part
HDMI1 = HDMI-SWM-19: Supplier Part: C138388
LED1 = LED_0603-R: Supplier Footprint: 0603; Supplier Part: C84263
LED2 = LED_0603-B: Supplier Footprint: 0603; Supplier Part: C84266
Q1 Q2 = 2N7002_C8545: 类型:1个N沟道;漏源电压(Vdss):60V;连续漏极电流(Id):115mA;导通电阻(RDS(on)@Vgs,Id):5Ω@10V;功率(Pd):225mW;阈值电压(Vgs(th)@Id):2.5V@250uA;; LCSC Part Name: 1个N沟道 耐压:60V 电流:115mA; Supplier Part: C8545; Manufacturer: CJ(江苏长电/长晶); Supplier Footprint: SOT-23; JLCPCB Part Class: Basic Part; Datasheet: https://atta.szlcsc.com/upload/public/pdf/source/20171228/C164913_15144413269051213916.pdf; Supplier: LCSC; Type: 1个N沟道; Drain Source Voltage (Vdss): 60V; Continuous Drain Current (Id): 115mA; Drain Source On Resistance (RDS(on)@Vgs,Id): 5Ω@10V; Power Dissipation (Pd): 225mW; Gate Threshold Voltage (Vgs(th)@Id): 2.5V@250uA; Input Capacitance (Ciss@Vds): 50pF; Reverse Transfer Capacitance (Crss@Vds): 5pF; Operating Temperature: -55℃~+150℃
R3 R13 R39 R49 R74 R75 = 0603WAF4701T5E: 电阻类型:厚膜电阻;阻值:4.7kΩ;精度:±1%;功率:100mW;最大工作电压:75V;温度系数:±100ppm/℃;; LCSC Part Name: 4.7kΩ ±1% 100mW 厚膜电阻; Supplier Part: C23162; Manufacturer: UNI-ROYAL(厚声); Supplier Footprint: 0603; JLCPCB Part Class: 基础库; Datasheet: https://atta.szlcsc.com/upload/public/pdf/source/20200306/C422600_1E6D84923E4A46A82E41ADD87F860B5C.pdf; Supplier: LCSC; Type: 厚膜电阻; Tolerance: ±1%; Power(Watts): 100mW; Overload Voltage (Max): 75V; Temperature Coefficient: ±100ppm/℃; Operating Temperature Range: -55℃~+155℃
R4 R6 R7 R9-R12 R14 R19 R20 R47 = 0402WGF499JTCE: 电阻类型:厚膜电阻;阻值:49.9Ω;精度:±1%;功率:62.5mW;最大工作电压:50V;温度系数:±100ppm/℃;; LCSC Part Name: 49.9Ω ±1% 62.5mW 厚膜电阻; Supplier Part: C25120; Manufacturer: UNI-ROYAL(厚声); Supplier Footprint: 0402; JLCPCB Part Class: Basic Part; Datasheet: https://atta.szlcsc.com/upload/public/pdf/source/20200306/C422600_1E6D84923E4A46A82E41ADD87F860B5C.pdf; Supplier: LCSC; Type: 厚膜电阻; Tolerance: ±1%; Power(Watts): 62.5mW; Overload Voltage (Max): 50V; Temperature Coefficient: ±100ppm/℃; Operating Temperature Range: -55℃~+155℃
R15 = 0603WAF1202T5E: 电阻类型:厚膜电阻;阻值:12kΩ;精度:±1%;功率:100mW;最大工作电压:75V;温度系数:±100ppm/℃;; LCSC Part Name: 12kΩ ±1% 100mW 厚膜电阻; Supplier Part: C22790; Manufacturer: UNI-ROYAL(厚声); Supplier Footprint: 0603; JLCPCB Part Class: 基础库; Datasheet: https://atta.szlcsc.com/upload/public/pdf/source/20200306/C422600_1E6D84923E4A46A82E41ADD87F860B5C.pdf; Supplier: LCSC; Type: 厚膜电阻; Tolerance: ±1%; Power(Watts): 100mW; Overload Voltage (Max): 75V; Temperature Coefficient: ±100ppm/℃; Operating Temperature Range: -55℃~+155℃
R17 = 1M: Supplier Part: C25752
R22 R29 = NC: Supplier Part: C25752
SW1-SW3 = TC-6615-5-260G: 电路结构:单刀单掷;按钮形状:-;作用力:260gf;安装方式:卧插;开关长度:6mm;开关宽度:6mm;开关高度:5mm;带支架:带支架;触点电流:50mA;额定电压(AC):-;额定电压(DC):12V;额定功率:-;绝缘电阻:-;带灯:-;机械寿命:-;; LCSC Part Name: 轻触6*6*5支架 插件260g; Supplier Part: C2845270; Manufacturer: HCTL(华灿天禄); Supplier Footprint: 插件; JLCPCB Part Class: 扩展库; Datasheet: https://atta.szlcsc.com/upload/public/pdf/source/20230523/3B07ECEFF69432C539FEAF1B55455C52.pdf; Supplier: LCSC; Circuit: 单刀单掷; Operating Force: 260gf; Mounting Style: 卧插; Switch Length: 6mm; Switch Width: 6mm; Switch Height: 5mm; Strike Gundam: 带支架; Contact Current: 50mA; Voltage Rating (DC): 12V
U1 = NCS8803: Supplier: LCSC; Supplier Part: C9900014706; Manufacturer: null; JLCPCB Part Class: Extended Part
U2 = STM32F103C8T6: CPU内核:CM3;程序存储容量:64KB;RAM总容量:20KB;GPIO端口数量:37;工作电压范围:2V~3.6V;CPU最大主频:72MHz;程序存储器类型:FLASH;; LCSC Part Name: STM32F103C8T6 MSL=3; Supplier Part: C8734; Manufacturer: ST(意法半导体); Supplier Footprint: LQFP-48(7x7); JLCPCB Part Class: 扩展库; Datasheet: https://atta.szlcsc.com/upload/public/pdf/source/20220812/8363ACEC51AD55ECEB84799464F7CB85.pdf; Supplier: LCSC; CPU Core: CM3; Program Storage Size: 64KB; RAM Size: 20KB; GPIO Ports Number: 37; Operating Voltage Range: 2V~3.6V; CPU Maximum Speed: 72MHz; Program Memory Type: FLASH; Operating Temperature Range: -40℃~+85℃; ADC (Bit): 12bit; Universal Serial Bus: 有; Peripheral/Function: 看门狗；DMA；看门狗；片载温度传感器; Watchdog: 有; Infrared Data Association: 有; Low-Voltage Detect: 有; Direct Memory Access: 有; Internal Oscillator: 有
X1 = X252012MMB4SI-24: Supplier: LCSC; Supplier Part: C2896601; Manufacturer: YXC扬兴科技; JLCPCB Part Class: Extended Part
C43 C53 = CL10B224KA8NNNC: 容值:220nF;精度:±10%;额定电压:25V;材质(温度系数):X7R;; LCSC Part Name: 220nF ±10% 25V; Supplier Part: C21120; Manufacturer: SAMSUNG(三星); Supplier Footprint: 0603; JLCPCB Part Class: Basic Part; Datasheet: https://atta.szlcsc.com/upload/public/pdf/source/20160218/1457707763339.pdf; Supplier: LCSC; Tolerance: ±10%; Voltage Rated: 25V; Temperature Coefficient: X7R
C46 C51 = CL10B102KB8NNNC: 容值:1nF;精度:±10%;额定电压:50V;材质(温度系数):X7R;; LCSC Part Name: 1nF ±10% 50V; Supplier Part: C1588; Manufacturer: SAMSUNG(三星); Supplier Footprint: 0603; JLCPCB Part Class: Basic Part; Datasheet: https://atta.szlcsc.com/upload/public/pdf/source/20160218/1457707763339.pdf; Supplier: LCSC; Tolerance: ±10%; Voltage Rated: 50V; Temperature Coefficient: X7R
D1 = SS34_C727060: 二极管配置:独立式;正向压降(Vf):550mV@3A;直流反向耐压(Vr):40V;平均整流电流(Io):3A;; LCSC Part Name: 电压:40V 电流:3A; Supplier Part: C727060; Manufacturer: TWGMC(台湾迪嘉); Supplier Footprint: SMA(DO-214AC); JLCPCB Part Class: 扩展库; Datasheet: https://atta.szlcsc.com/upload/public/pdf/source/20200828/C727059_6599B6CAC5F3238B9C33E46794659DBE.pdf; Supplier: LCSC; Diode Configuration: 独立式; Forward Voltage (Vf@If): 550mV@3A; Reverse Voltage (Vr): 40V; Average Rectified Current (Io): 3A; Reverse Leakage Current (Ir): 500uA@40V
L1 L2 = CD31YP0301-4R7M: 电感值:4.7uH;精度:±20%;额定电流:660mA;; LCSC Part Name: 4.7uH ±20%; Supplier Part: C492253; Manufacturer: YJYCOIN(益嘉源); Supplier Footprint: SMD,3.5x3x1.6mm; JLCPCB Part Class: Extended Part; Datasheet: https://atta.szlcsc.com/upload/public/pdf/source/20210121/C724307_282B52DBCCD31BC993177F2648C08006.pdf; Supplier: LCSC; Tolerance: ±20%; Rated Current: 660mA; DC Resistance (DCR): 376mΩ
L3 = CD31YP0301-2R2M: 电感值:2.2uH;精度:±20%;额定电流:880mA;; LCSC Part Name: 2.2uH ±20%; Supplier Part: C492251; Manufacturer: YJYCOIN(益嘉源); Supplier Footprint: SMD,3.5x3x1.6mm; JLCPCB Part Class: Extended Part; Datasheet: https://atta.szlcsc.com/upload/public/pdf/source/20210121/C724307_282B52DBCCD31BC993177F2648C08006.pdf; Supplier: LCSC; Tolerance: ±20%; Rated Current: 880mA; DC Resistance (DCR): 194mΩ
L4 = SMMS0420-220M: 电感值:22uH;精度:±20%;额定电流:1.2A;饱和电流(Isat):1.5A;类型:一体成型电感;; LCSC Part Name: 22uH ±20% 1.5A; Supplier Part: C2894720; Manufacturer: SXN(顺翔诺); Supplier Footprint: SMD,4.6x4.2x2mm; JLCPCB Part Class: Extended Part; Datasheet: https://atta.szlcsc.com/upload/public/pdf/source/20210910/523B6BB0C4A09F37806A127B1ABE761D.pdf; Supplier: LCSC; Tolerance: ±20%; Rated Current: 1.2A; Saturation Current (Isat): 1.5A; DC Resistance (DCR): 510mΩ; Type: 一体成型电感
R32 = 1206W3F300MT5E: 电阻类型:厚膜电阻;阻值:30mΩ;精度:±1%;功率:333.333mW;最大工作电压:200V;; LCSC Part Name: 30mΩ ±1% 333.333mW 厚膜电阻; Supplier Part: C473665; Manufacturer: UNI-ROYAL(厚声); Supplier Footprint: 1206; JLCPCB Part Class: Extended Part; Datasheet: https://atta.szlcsc.com/upload/public/pdf/source/20200306/C422600_1E6D84923E4A46A82E41ADD87F860B5C.pdf; Supplier: LCSC; Type: 厚膜电阻; Tolerance: ±1%; Power(Watts): 333.333mW; Overload Voltage (Max): 200V; Operating Temperature Range: -55℃~+155℃
R33 R34 R37 = MF73T-1 1/16: Supplier Part: C123334; Supplier: LCSC; Manufacturer: Nanjing Shiheng Elec; nameAlias: Value(Ω); Contributor: LCEDA_Lib; spicePre: R; spiceSymbolName: R_0603_EU
R35 = 0402WGF2003TCE: 电阻类型:厚膜电阻;阻值:200kΩ;精度:±1%;功率:62.5mW;最大工作电压:50V;温度系数:±100ppm/℃;; LCSC Part Name: 200kΩ ±1% 62.5mW 厚膜电阻; Supplier Part: C25764; Manufacturer: UNI-ROYAL(厚声); Supplier Footprint: 0402; JLCPCB Part Class: Basic Part; Datasheet: https://atta.szlcsc.com/upload/public/pdf/source/20200306/C422600_1E6D84923E4A46A82E41ADD87F860B5C.pdf; Supplier: LCSC; Type: 厚膜电阻; Tolerance: ±1%; Power(Watts): 62.5mW; Overload Voltage (Max): 50V; Temperature Coefficient: ±100ppm/℃; Operating Temperature Range: -55℃~+155℃
R40 = 0603WAF1001T5E: 电阻类型:厚膜电阻;阻值:1kΩ;精度:±1%;功率:100mW;最大工作电压:75V;温度系数:±100ppm/℃;; LCSC Part Name: 1kΩ ±1% 100mW 厚膜电阻; Supplier Part: C21190; Manufacturer: UNI-ROYAL(厚声); Supplier Footprint: 0603; JLCPCB Part Class: 基础库; Datasheet: https://atta.szlcsc.com/upload/public/pdf/source/20200306/C422600_1E6D84923E4A46A82E41ADD87F860B5C.pdf; Supplier: LCSC; Type: 厚膜电阻; Tolerance: ±1%; Power(Watts): 100mW; Overload Voltage (Max): 75V; Temperature Coefficient: ±100ppm/℃; Operating Temperature Range: -55℃~+155℃
R42 = 1206W4F0000T5E: 电阻类型:厚膜电阻;阻值:0Ω;精度:±1%;功率:250mW;最大工作电压:200V;温度系数:±800ppm/℃;; LCSC Part Name: 0Ω ±1% 250mW 厚膜电阻; Supplier Part: C17888; Manufacturer: UNI-ROYAL(厚声); Supplier Footprint: 1206; JLCPCB Part Class: Basic Part; Datasheet: https://atta.szlcsc.com/upload/public/pdf/source/20200306/C422600_1E6D84923E4A46A82E41ADD87F860B5C.pdf; Supplier: LCSC; Type: 厚膜电阻; Tolerance: ±1%; Power(Watts): 250mW; Overload Voltage (Max): 200V; Temperature Coefficient: ±800ppm/℃; Operating Temperature Range: -55℃~+155℃
U3 = none: Manufacturer: X-Power; Contributor: mondraker; spicePre: U
U4 = MT3608: 功能类型:升压型;输入电压:2V~24V;输出电压:28V;输出电流(最大值):-;; Supplier Part: C84817; Manufacturer: 西安航天民芯; Supplier Footprint: SOT-23-6; JLCPCB Part Class: 扩展库; Datasheet: https://atta.szlcsc.com/upload/public/pdf/source/20161110/1478743351706.pdf; Supplier: LCSC; Function: 升压型; Input Voltage: 2V~24V; Output Voltage: 28V; Switching Frequency: 1.2MHz; Number of Outputs: 1; Topology: 升压式; Switch tube (built-in/external): 内置

## Nets
12V_EN: R44.2 U2.14(PA4) U4.4(EN)
AGND: C79.2 C80.2 C81.1 C82.2 C86.1 C88.1 C89.2 C90.1 C91.1 R52.2 R58.1 R60.1 R61.2 R63.1 U5.9(NC) U5.11(GND) U6.8(GND)
GND: C16.2 C18.1 C21.2 C22.2 C23.2 C24.2 C25.2 C26.2 C27.2 C28.2 C29.1 C30.1 C31.1 C32.1 C33.2 C34.2 C35.2 C36.2 C37.2 C38.2 C40.1 C41.1 C42.2 C43.1 C44.2 C45.1 C46.2 C47.1 C48.2 C49.2 C51.2 C52.2 C54.2 C56.2 C57.2 C58.1 C59.2 C60.2 C61.2 C62.2 C63.1 C64.2 C65.1 C66.1 C67.1 C68.1 C69.1 C70.1 C71.1 C72.1 C73.1 C74.1 C75.1 C76.1 C77.1 C78.2 C92.1 CN1.1(-) E1.3(GND) E1.8(GND) E2.3(GND) E2.8(GND) FPC1.2 FPC1.5 FPC1.8 FPC1.11 FPC1.14 FPC1.17 FPC1.23 FPC1.24 FPC1.25 FPC1.26 FPC1.28 FPC1.29 FPC1.30 FPC1.31 FPC1.41 FPC1.42 FPC2.5 FPC2.6 FPC3.4 FPC3.5 FPC3.6 FPC4.4 FPC4.5 FPC4.6 H1.1 H6.4 HDMI1.2 HDMI1.5 HDMI1.8 HDMI1.11 HDMI1.17 HDMI1.20 HDMI1.21 HDMI1.22 HDMI1.23 LED1.1(C) LED2.1(C) R3.2 R8.1 R16.1 R21.1 R27.2 R28.2 R38.1 R44.1 R46.2 R48.1 R49.1 R62.1 R63.2 R66.2 R67.1 R68.2 R71.2 R72.2 R73.2 SCREW1.1 SCREW2.1 SCREW3.1 SCREW4.1 SCREW5.1 SCREW6.1 SCREW7.1 SW1.2 SW1.3 SW1.4 SW2.1 SW2.3 SW2.4 SW3.2 SW3.3 SW3.4 SW4.1 U1.57(EP) U2.8(VSSA) U2.23(VSS_1) U2.35(VSS_2) U2.47(VSS_3) U3.9(PGND2) U3.16(PGND3) U3.37(TS) U3.46(PGND1) U3.49(EP) U4.2(GND) U5.2(PGND) U5.15(PGND) U7.1 U7.3 U7.4 USB1.1(GND) USB1.12(GND) USB1.13(SHELL) USB1.14(SHELL) USB2.7(EH) USB2.A12(GND) USB2.B12(GND) X1.2(GND) X1.4(GND)
VBAT: C39.2 C40.2 C69.2 C70.2 CN1.2(+) R32.1 U3.38(BAT) U3.39(BAT) U3.42(BATSENSE)
VBUS: C75.2 C76.2 R34.1 U3.31(VBUS) USB1.2(VBUS) USB1.11(VBUS)
VINT: C50.2 R41.2 U3.26(VINT)
ACIN: C73.2 C74.2 R33.1 U3.32(ACIN) U3.33(ACIN) USB2.A9(VBUS) USB2.B9(VBUS)
AUDIO_L: C83.1 R56.2 R58.2
AUDIO_R: C84.1 R52.1 R55.1
AXP_IRQ: R47.2 U2.11(PA1)
AXP_PWRON: R39.2 R40.1 SW3.1
BL_VCC12: C67.2 C68.2 D1.1(C) FPC1.36 FPC1.37 FPC1.38 FPC1.39 R42.2 R43.2
BOOT0: R28.1 U2.44(BOOT0)
BOOT1: R27.1 U2.20(PB2)
DC3SET: C59.1 R39.1 U3.28(LDO1) U3.29(DC3SET)
DCDC2_1V2: C23.1 C24.1 C25.1 C26.1 C33.1 C34.1 C46.1 C48.1 L2.2 U1.8(HSDVDD12) U1.13(HSDVDD12) U1.15(HSDVDD12) U1.16(HSDVDD12) U1.17(HSDVDD12) U1.18(HSDVDD12) U1.19(AVDD12) U1.20(AVDD12) U1.21(AVDD12) U1.26(AVDD12) U1.27(AVDD12) U1.28(AVDD12) U1.43(AVDD12) U1.52(DVDD12) U3.10(DCDC2)
DCDC3_3V3: C27.1 C28.1 C35.1 C36.1 C37.1 C38.1 C51.1 C52.1 FPC1.18 FPC1.19 FPC1.20 FPC1.21 L3.2 Q1.1(G) Q2.1(G) R1.1 R4.2 R6.2 R7.2 R9.2 R10.2 R11.2 R12.2 R13.2 R14.2 R25.1 R30.1 U1.14(HSDVDD33) U1.31(AVDD33) U1.32(AVDD33) U1.47(DVDD33) U3.17(DCDC3)
DDCSCL: Q1.2(S) R22.2 R25.2 U1.50(DDCSCL)
DDCSDA: Q2.2(S) R29.2 R30.2 U1.51(DDCSDA)
DP_AUX_N: C1.1 FPC1.16 R1.2
DP_AUX_P: C3.1 FPC1.15 R8.2
DP_LANE0_N: C7.1 FPC1.12
DP_LANE0_P: C9.1 FPC1.13
DP_LANE1_N: C11.1 FPC1.9
DP_LANE1_P: C13.1 FPC1.10
DP_LANE2_N: C15.1 FPC1.6
DP_LANE2_P: C17.1 FPC1.7
DP_LANE3_N: C19.1 FPC1.3
DP_LANE3_P: C20.1 FPC1.4
DPO0_N: C7.2 U1.41(DPO3N)
DPO0_P: C9.2 U1.42(DPO3P)
DPO1_N: C11.2 U1.39(DPO2N)
DPO1_P: C13.2 U1.40(DPO2P)
DPO2_N: C15.2 U1.37(DPO1N)
DPO2_P: C17.2 U1.38(DPO1P)
DPO3_N: C19.2 U1.35(DPO0N)
DPO3_P: C20.2 U1.36(DPO0P)
DPOAUX_N: C1.2 U1.34(AUXON)
DPOAUX_P: C3.2 U1.33(AUXOP)
EXTEN: C61.1 U3.20(EXTEN)
HDMI_5V: C16.1 HDMI1.18 R15.1 R26.1 R31.1
HDMI_DDC_SCL: HDMI1.15 Q1.3(D) R22.1 R26.2
HDMI_DDC_SDA: HDMI1.16 Q2.3(D) R29.1 R31.2
HPD_IN: R15.2 R16.2 U1.49(HPDDET) U2.10(PA0-WKUP)
HPD_OUT: C18.2 HDMI1.19 U1.48(HPDOUT)
HSI0N: C5.1 U1.6(HSI0N)
HSI0P: C6.1 U1.7(HSI0P)
HSI1N: C8.1 U1.9(HSI1N)
HSI1P: C10.1 U1.10(HSI1P)
HSI2N: C12.1 U1.11(HSI2N)
HSI2P: C14.1 U1.12(HSI2P)
HSICN: C2.1 U1.4(HSICN)
HSICP: C4.1 U1.5(HSICP)
I2C_MASTER: R13.1 U1.3(I2CMASTERENB)
I2S_MCLK: U1.2(I2SMCK) U6.4(MCLK)
I2S_SCLK: U1.1(I2SSCK) U6.2(DEM#/SCLK)
I2S_SD0: U1.56(I2SSD) U6.1(SDIN)
I2S_WFS: U1.55(I2SWS) U6.3(LRCK)
L_SPK+: FPC2.4 U5.1(OUTL+)
L_SPK-: FPC2.3 U5.3(OUTL-)
LDO2_3V3: C60.1 C79.1 C80.1 C81.2 U3.12(LDO2) U5.6(VDD) U6.9(VA)
LDO3: C62.1 U3.41(LDO3)
LDO4_3V3: C29.2 C30.2 C31.2 C32.2 C64.1 FPC4.3 H6.1 R23.1 R69.2 R74.1 R75.1 U2.1(VBAT) U2.9(VDDA) U2.24(VDD_1) U2.36(VDD_2) U2.48(VDD_3) U3.11(LDO4)
N_OE: R49.2 U3.4(N_OE)
N_VBUSEN: R48.2 U3.6(N_VBUSEN)
NCS_RST: H4.1 U1.46(RSTB) U2.12(PA2)
NCS_SCL: H3.1
NCS_SDA: H2.1
NCS_TEST: H5.1 U1.44(TEST)
PA8: U2.29(PA8)
PA11: U2.32(PA11)
PA12: U2.33(PA12)
PA13/SWDIO: H6.5 U2.34(PA13)
PA14/SWCLK: H6.6 U2.37(PA14)
PA15: U2.38(PA15)
PAGND: C50.1 C53.1 C55.1 R35.1 R38.2 U3.22(AGND)
PAM_MUTE: R60.2 U2.25(PB12) U5.5(MUTE#)
PAM_OFF: R59.1 R61.1 U2.26(PB13) U5.12(SHDN#)
PB0: U2.18(PB0)
PB1: U2.19(PB1)
PB3: U2.39(PB3)
PB4: R24.1 U2.40(PB4)
PB10: U2.21(PB10)
PB11: U2.22(PB11)
PB14: U2.27(PB14)
PB15: U2.28(PB15)
PC13: U2.2(PC13-TAMPER-RTC)
PC14: U2.3(PC14-OSC32_IN)
PC15: U2.4(PC15-OSC32_OUT)
PD0: U2.5(PD0-OSC_IN)
PD1: U2.6(PD1-OSC_OUT)
PMU_GPIO0: C58.2 U3.19(GPIO0/LDO5)
PMU_GPIO1: U3.18(GPIO1)
PMU_GPIO2: U3.5(GPIO2)
PMU_GPIO3: U3.3(GPIO3)
PMU_IRQ: R47.1 U3.48(IRQ)
PMU_SCK: FPC4.1 R74.2 U1.53(SCL) U2.42(PB6) U3.2(SCK)
PMU_SDA: FPC4.2 R75.2 U1.54(SDA) U2.43(PB7) U3.1(SDA)
PWD: R3.1 U1.45(PWD)
PWREN: R41.1 U3.27(PWREN)
PWROK: C92.2 R69.1 SW4.2 U2.7(NRST) U3.25(PWROK)
R_SPK+: FPC2.1 U5.16(OUTR+)
R_SPK-: FPC2.2 U5.14(OUTR-)
SCR_EN: R19.1 U2.15(PA5)
SCR_ENA: FPC1.32 R19.2
SCR_HPD: R20.1 U2.16(PA6)
SCR_HPDA: FPC1.27 R20.2 R21.2
SCR_PWM: R18.1 U2.17(PA7)
SCR_PWMA: FPC1.33 R18.2
ST_LIGDN: SW2.2 U2.46(PB9)
ST_LIGUP: SW1.1 U2.45(PB8)
ST_U1_RX: H6.2 U2.31(PA10)
ST_U1_TX: H6.3 U2.30(PA9)
TMDS_CK_N: C2.2 E2.1(I/O1) E2.10(NC) HDMI1.12 R14.1
TMDS_CK_P: C4.2 E2.2(I/O2) E2.9(NC) HDMI1.10 R12.1
TMDS_D0_N: C5.2 E2.4(I/O3) E2.7(NC) HDMI1.9 R11.1
TMDS_D0_P: C6.2 E2.5(I/O4) E2.6(NC) HDMI1.7 R10.1
TMDS_D1_N: C8.2 E1.1(I/O1) E1.10(NC) HDMI1.6 R9.1
TMDS_D1_P: C10.2 E1.2(I/O2) E1.9(NC) HDMI1.4 R7.1
TMDS_D2_N: C12.2 E1.4(I/O3) E1.7(NC) HDMI1.3 R6.1
TMDS_D2_P: C14.2 E1.5(I/O4) E1.6(NC) HDMI1.1 R4.1
USB_D+: FPC3.2 USB1.6(DP1) USB1.8(DP2)
USB_D-: FPC3.3 USB1.5(DN2) USB1.7(DN1)
USB_TP_CTL: U2.41(PB5) U7.2
USB_TP_ON: R65.1 R66.1 U2.13(PA3)
VAMP: C77.2 C78.1 Q3.3(D) U5.4(PVDD) U5.13(PVDD)
VSYS: BEAD1.2 C41.2 C43.2 C44.1 C49.1 C54.1 C56.1 C65.2 C66.2 C71.2 C72.2 L4.1 Q5.2(S) R36.1 R37.1 R42.1 R64.2 U3.7(VIN2) U3.14(VIN3) U3.34(IPSOUT) U3.35(IPSOUT) U3.40(LDO3IN) U3.44(VIN1) U4.5(IN)
VTPA: FPC3.1 Q5.3(D)
XTALIN: C21.1 R17.2 U1.29(XTALIN) X1.1
XTALOUT: C22.1 R17.1 U1.30(XTALOUT) X1.3
$1N2014: LED2.2(A) R24.2
$1N2019: LED1.2(A) R23.2
$2N2163: C57.1 R37.2 U3.13(LDO24IN)
$2N2176: L3.1 U3.15(LX3)
$2N2192: C39.1 C42.1 L1.2 R32.2 U3.43(CHSENSE)
$2N2196: L2.1 U3.8(LX2)
$2N2197: L1.1 U3.45(LX1)
$2N2219: C53.2 R36.2 U3.21(APS)
$2N2222: R35.2 U3.23(BIAS)
$2N2223: C55.2 U3.24(VREF)
$2N2239: C47.2 R34.2
$2N2245: C45.2 R33.2
$2N2267: C63.2 R40.2 U3.47(PWRON)
$2N6923: R45.1 R46.1 U4.3(FB)
$2N6925: R43.1 R45.2
$2N6929: D1.2(A) L4.2 U4.1(SW)
$3N1625: C90.2 U6.6(FILT+)
$3N1658: C88.2 C89.1 U6.5(VQ)
$3N1681: R53.1 U5.7(INL)
$3N1683: C86.2 U5.8(VREF)
$3N1684: C83.2 R53.2
$3N1688: Q4.2(E) R62.2
$3N1689: Q3.1(G) Q4.3(C) R57.1
$3N1690: Q4.1(B) R59.2
$3N1696: C84.2 R54.1
$3N1697: R54.2 U5.10(INR)
$3N3674: C87.2 C91.2 R56.1
$3N3678: C87.1 U6.10(AOUTR)
$3N3684: C82.1 C85.2 R55.2
$3N3689: C85.1 U6.7(AOUTL)
$3N4731: BEAD1.1 Q3.2(S) R57.2
$4N1203: R71.1 USB1.4(CC1)
$4N1208: R68.1 USB1.10(CC2)
$4N1222: R72.1 USB2.B5(CC2)
$4N1223: R73.1 USB2.A5(CC1)
$4N1594: Q6.2(E) R67.2
$4N1595: Q5.1(G) Q6.3(C) R64.1
$4N1603: Q6.1(B) R65.2

Not connected (* = marked no-connect by the designer): FPC1 1* 22* 34* 35* 40*; HDMI1 13* 14*; U1 22(NC)* 23(NC)* 24(NC)* 25(NC)*; U3 30(BACKUP)* 36(CHGLED)*; U4 6(NC)*; USB1 3(SBU2)* 9(SBU1)*

## Notes on the sheets
sheet 1
- NCS8803 HDMI-EDP CONVERTER
- EDP 40P CONN
- 8bit iic address:
       0xE0,0xea
- STM32F103 MAIN CONTROLLER
- C6T6
sheet 2
- 8bit iic address:0x68
- 30mΩ/±1%/1206
- AXP202
- POWER MANAGEMENT
              SYSTEM
- 开机按钮
- 精度务必≤±1%
- 12V Boost Power（optional）
- Vout=0.6（1+R5/R6）
sheet 3
- CS4344 & PAM8403 AUDIO PART
- PAMOFF-系统关断（低电平有效）
- MUTE-静音（低电平有效）
- CS4344 DAC DECODER
- PAM8403 AUDIO PA
- PAM8403 POWER CONTROLLER
sheet 4
- CONNECTOR
- NCS DEBUG CONN
- BATT CONN
- SPK CONN
- ST DEBUG CONN
- ST RESET
- 8-add:0x78
- Type-C USB
- Type-C POWER
- 0.91 OLED CONN
- USB2 CONN
- TPEN CONN
- 低电平关
- TP POWER CTRL
